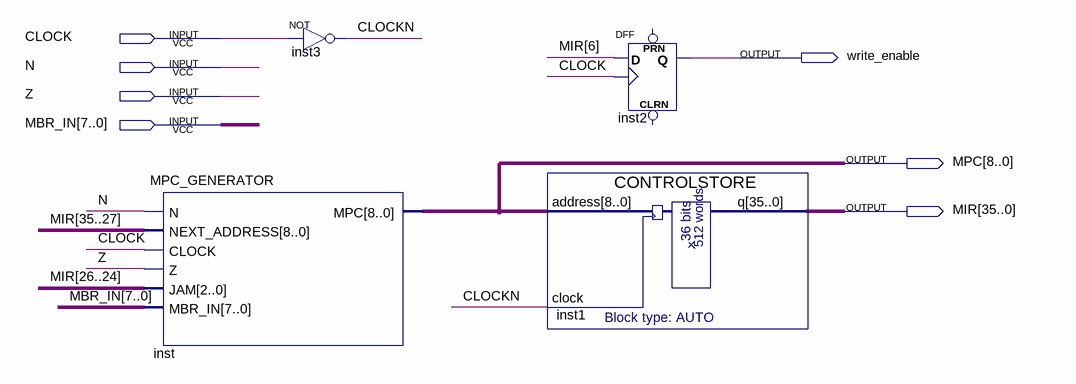
[diagram p0: schematic sheet]
// Quartus schematic CPU1.bdf as structural Verilog: 4 symbols, 7 pins
module CPU1 (
  input  CLOCK,
  input  N,
  input  Z,
  input  [7:0] MBR_IN,
  output write_enable,
  output [8:0] MPC,
  output [35:0] MIR
);

  wire CLOCKN;

  MPC_GENERATOR inst (
    .N(N), .NEXT_ADDRESS(MIR[35:27]), .CLOCK(CLOCK), .Z(Z), .JAM(MIR[26:24]), .MBR_IN(MBR_IN), .MPC(MPC));
  not inst3 (CLOCKN, CLOCK);
  DFF inst2 (.CLK(CLOCK), .D(MIR[6]), .Q(write_enable));  // open: CLRN, PRN
  CONTROLSTORE inst1 (.address(MPC), .clock(CLOCKN), .q(MIR));
endmodule
